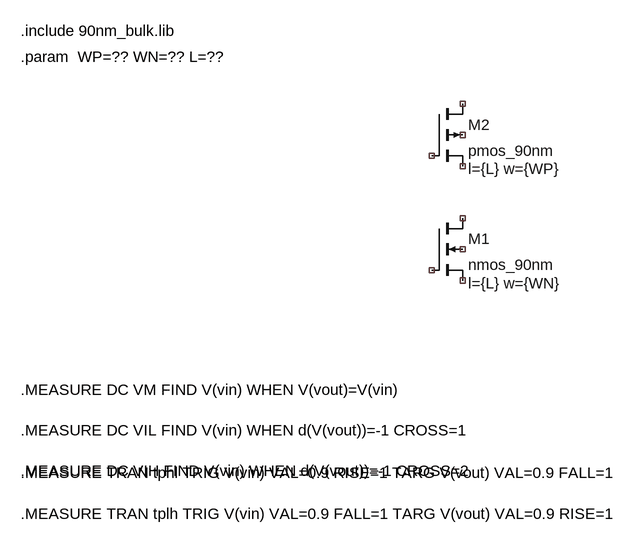
[diagram p0: schematic CMOS_Inverter.asc]
CMOS_Inverter.asc, the LTspice schematic file:
Version 4.1
SHEET 1 880 716
SYMBOL nmos4 -48 240 R0
WINDOW 123 56 100 Left 2
SYMATTR Value2 l={L} w={WN}
SYMATTR InstName M1
SYMATTR Value nmos_90nm
SYMBOL pmos4 -48 64 R0
WINDOW 123 56 100 Left 2
SYMATTR Value2 l={L} w={WP}
SYMATTR InstName M2
SYMATTR Value pmos_90nm
TEXT -680 -48 Left 2 !.include 90nm_bulk.lib
TEXT -680 -8 Left 2 !.param  WP=?? WN=?? L=??
TEXT -680 504 Left 2 !.MEASURE DC VM FIND V(vin) WHEN V(vout)=V(vin)\n\n.MEASURE DC VIL FIND V(vin) WHEN d(V(vout))=-1 CROSS=1\n\n.MEASURE DC VIH FIND V(vin) WHEN d(V(vout))=-1 CROSS=2
TEXT -680 632 Left 2 !.MEASURE TRAN tphl TRIG V(vin) VAL=0.9 RISE=1 TARG V(vout) VAL=0.9 FALL=1\n\n.MEASURE TRAN tplh TRIG V(vin) VAL=0.9 FALL=1 TARG V(vout) VAL=0.9 RISE=1

The netlist it stands for:
* CMOS_Inverter.asc
M1 NC_01 NC_02 NC_03 NC_04 nmos_90nm l={L} w={WN}
M2 NC_05 NC_06 NC_07 NC_08 pmos_90nm l={L} w={WP}
.model NMOS NMOS
.model PMOS PMOS
.lib standard.mos
.include 90nm_bulk.lib
.param  WP=?? WN=?? L=??
.MEASURE DC VM FIND V(vin) WHEN V(vout)=V(vin)
.MEASURE DC VIL FIND V(vin) WHEN d(V(vout))=-1 CROSS=1
.MEASURE DC VIH FIND V(vin) WHEN d(V(vout))=-1 CROSS=2
.MEASURE TRAN tphl TRIG V(vin) VAL=0.9 RISE=1 TARG V(vout) VAL=0.9 FALL=1
.MEASURE TRAN tplh TRIG V(vin) VAL=0.9 FALL=1 TARG V(vout) VAL=0.9 RISE=1
.backanno
.end